# Altium schematic sheet NanoD1_IO.SchDoc
size 420 x 297 mm; SheetNumber: 8; SheetTotal: 8; SPICEModelCacheMQURISAM: <root> / <DocumentId>MQURISAM</DocumentId> / </root>
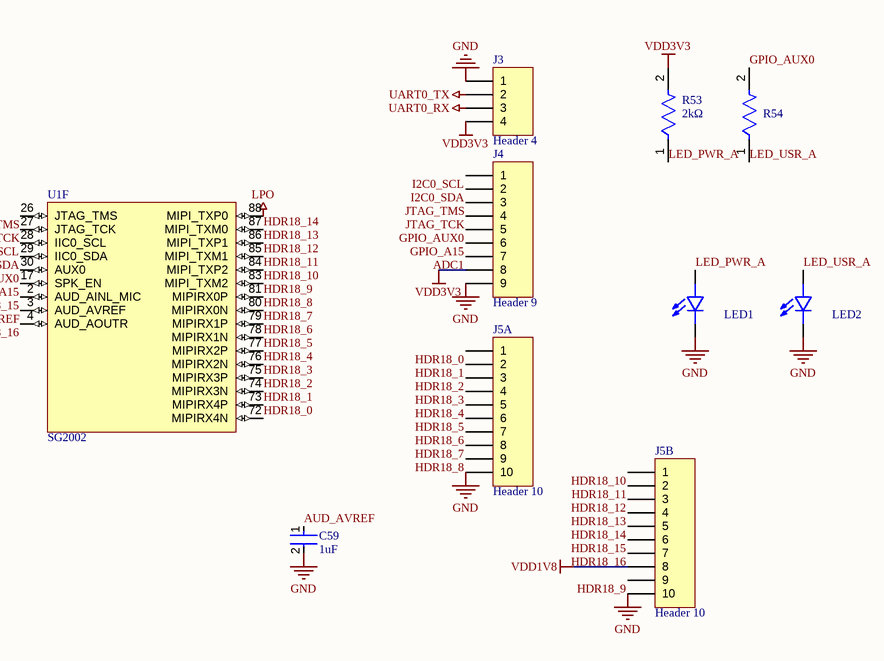
[diagram p0: NanoD1_IO.SchDoc]

## Parts
C59  1uF  [FP-GRM15-0_1-IPC_B]
J3  Header 4  [HDR1X4]
J4  Header 9  [HDR1X9]
J5A  Header 10  [HDR1X10]
J5B  Header 10  [HDR1X10]
LED1  KP-1608SGC  [LED_KP-1608SGC]  (value not drawn)
LED2  KP-1608SGC  [LED_KP-1608SGC]  (value not drawn)
R53  value 2kΩ  [FP-RC_L0402-IPC_A]  (hidden comment: 2K)
R54  1K  [FP-RC0402-0_4-MFG]  (value not drawn)
U1  SG2002  [QFN88-9x9-0.35]  (part F of 7)

## Nets
GND: C59.2 J3.1 J4.9 J5A.10 J5B.10 LED1.C LED2.C
LPO: U1.88(MIPI_TXP0)
UART0_RX: J3.3
UART0_TX: J3.2
VDD1V8: J5B.8
VDD3V3: J3.4 J4.8 R53.2
ADC1: J4.7
AUD_AVREF: C59.1 U1.3(AUD_AVREF)
GPIO_A15: J4.6 U1.17(SPK_EN)
GPIO_AUX0: J4.5 R54.2 U1.30(AUX0)
HDR18_0: J5A.1 U1.72(MIPIRX4N)
HDR18_1: J5A.2 U1.73(MIPIRX4P)
HDR18_2: J5A.3 U1.74(MIPIRX3N)
HDR18_3: J5A.4 U1.75(MIPIRX3P)
HDR18_4: J5A.5 U1.76(MIPIRX2N)
HDR18_5: J5A.6 U1.77(MIPIRX2P)
HDR18_6: J5A.7 U1.78(MIPIRX1N)
HDR18_7: J5A.8 U1.79(MIPIRX1P)
HDR18_8: J5A.9 U1.80(MIPIRX0N)
HDR18_9: J5B.9 U1.81(MIPIRX0P)
HDR18_10: J5B.1 U1.83(MIPI_TXM2)
HDR18_11: J5B.2 U1.84(MIPI_TXP2)
HDR18_12: J5B.3 U1.85(MIPI_TXM1)
HDR18_13: J5B.4 U1.86(MIPI_TXP1)
HDR18_14: J5B.5 U1.87(MIPI_TXM0)
HDR18_15: J5B.6 U1.2(AUD_AINL_MIC)
HDR18_16: J5B.7 U1.4(AUD_AOUTR)
I2C0_SCL: J4.1 U1.28(IIC0_SCL)
I2C0_SDA: J4.2 U1.29(IIC0_SDA)
JTAG_TCK: J4.4 U1.27(JTAG_TCK)
JTAG_TMS: J4.3 U1.26(JTAG_TMS)
LED_PWR_A: LED1.A R53.1
LED_USR_A: LED2.A R54.1

## Notes on the sheet
- THIS DOCUMENT AND THE DATA DISCLOSED HEREIN OR
- HEREWITH IS THE PROPERTY OF ALTIUM LIMITED AND MAY
- DWG NO:
- REVISION
- REV:
- DESCRIPTION
- DATE
- APPROVED
- BE FREELY DISTRIBUTED IN WHOLE. NO RIGHTS ARE
- RESERVED OR EXPRESS OR IMPLIED WARANTEE GIVEN.
- ENG:
- APPROVALS
- PROJECT
- DSN:
- CHK:
- REFERENCE DOCUMENTS
- PROJECT REVISION:
- TITLE
- DOCUMENT REVISION:
- DESIGN ITEM:
- BOM:
- FAB DWG:
- PCB DWG:
- ASSY DWG:
- SCALE:
- A3
- SIZE
- CAGE CODE
- FILE NAME
- DWG NO.
- SHEET
- OF
- REV

## Library data of the parts
C59 = CMP-2008-04556-2: CAP CER 1UF 10V X5R 0402; Manufacturer Part Number: GRM155R61A105KE15D; Manufacturer: Murata; Material: Ceramic; Tolerance: 10%; Temperature Coefficient: 15%; Value: 1uF; Octopart: https://octopart.com/grm155r61a105ke15d-murata-197442; Lead Free: Yes; ComponentLink2Description: Datasheet; Temperature: -55°C to +85°C; Temperature Range High: +85°C; Height: 0.55mm; Capacitance: 1uF; Ipc Land Pattern Name: CAPC10050X50; ComponentLink2URL: https://search.murata.co.jp/Ceramy/image/img/A01X/G101/ENG/GRM155R61A105KE15-01A.pdf; Temperature Range Low: -55°C; Device Class L2: Capacitors; Voltage Rating: 10V; RoHS: TRUE; Device Class L1: Passive Components; Device Class L3: Ceramic Capacitors; Temperature Characteristic: X5R; Mouser Description: 0402 1 uF 10 V ±10% Tolerance X5R Surface Mount Multilayer Ceramic Capacitor; Automotive: No; Package: GRM15-0.1; Digikey Description: CAP CER 1UF 10V X5R 0402; Category: Cap
J3 = Header 4: Header, 4-Pin; LatestRevisionDate: 17-Jul-2002; LatestRevisionNote: Re-released for DXP Platform.; Publisher: Altium Limited
J4 = Header 9: Header, 9-Pin; LatestRevisionDate: 17-Jul-2002; LatestRevisionNote: Re-released for DXP Platform.; Publisher: Altium Limited
J5A J5B = Header 10: Header, 10-Pin; LatestRevisionDate: 17-Jul-2002; LatestRevisionNote: Re-released for DXP Platform.; Publisher: Altium Limited
LED1 LED2 = KP-1608SGC: KP-1608SGC Green LED, 568 nm 1608 (0603), Rectangle Lens SMD package; MF: Kingbright; SnapEDA_Link: https://www.snapeda.com/parts/KP-1608SGC/Kingbright/view-part/?ref=snap; Package: 0603 Kingbright; Value: *; MP: KP-1608SGC; Check_prices: https://www.snapeda.com/parts/KP-1608SGC/Kingbright/view-part/?ref=eda
R53 = CMP-2002-07580-2: RES SMD 2K OHM 1% 1/16W 0402; Manufacturer: Yageo; Manufacturer Part Number: RC0402FR-072KL; Voltage Rating: 50V; Temperature Coefficient: 100ppm/°C; Power Rating: 0.0625W; Standoff Height: 0mm; Category: Res; Device Class L3: Chip SMD Resistors; Octopart: https://octopart.com/rc0402fr-072kl-yageo-5032519; Mouser Description: RES SMD 2K OHM 1% 1/16W 0402; RoHS: TRUE; Temperature: -55°C to +155°C; Device Class L2: Resistors; Series: RC_L; Automotive: No; Resistance: 2kΩ; Temperature Range Low: -55°C; Footprint Url: https://www.yageo.com/upload/website/yageo_PYu-R_Mount_10_19050818_343.pdf; Height: 0.4mm; ComponentLink2Description: Datasheet; Package: RC_L0402; ComponentLink2URL: http://www.yageo.com/documents/recent/PYu-RC_Group_51_RoHS_L_9.pdf; Temperature Range High: +155°C; Lead Free: Yes; Device Class L1: Passive Components; Ipc Land Pattern Name: RESC10050X35; Composition: Thick Film; Digikey Description: RES SMD 2K OHM 1% 1/16W 0402; Tolerance: 1%
R54 = CMP-2002-07472-3: RES 1K OHM 1% 1/16W 0402; Max Power Dissipation: 63mW; Resistance: 1kR; Voltage Rating (DC): 50V; Temperature Coefficient: 100ppm/°C; Power Rating: 62.5mW; Technology: THICK FILM; Size Code: 0402; Series: RC; Length: 1mm; Case/Package: 0402; Features: Moisture Resistant; Termination: SMD/SMT; Case Code (Metric): 1005; Reach SVHC Compliant: Yes; Number of Terminations: 2; Tolerance: 1%; Lead Free: Lead Free; Military Standard: Not; Resistor Type: Thick Film; Max Operating Temperature: 155°C; RoHS Compliant: Yes; Construction: Rectangular; Voltage Rating: 50V; Packaging: Tape and Reel; Height: 0.32mm; Number of Pins: 2; Resistance Tolerance: 1%; Case Code (Imperial): 0402; Depth: 0.5mm; Min Operating Temperature: -55°C; Width: 0.5mm
U1 = SG2002: RISC-V C906 / Cortex-A53 SoC, 256MB DDR3 SiP, QFN88 9x9 0.35mm